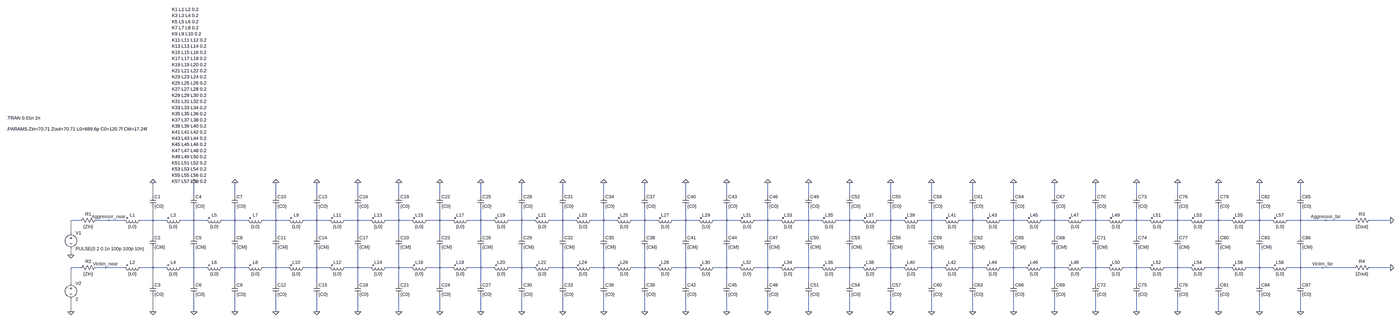
[diagram p0: schematic Exercise 3.asc, whole sheet]
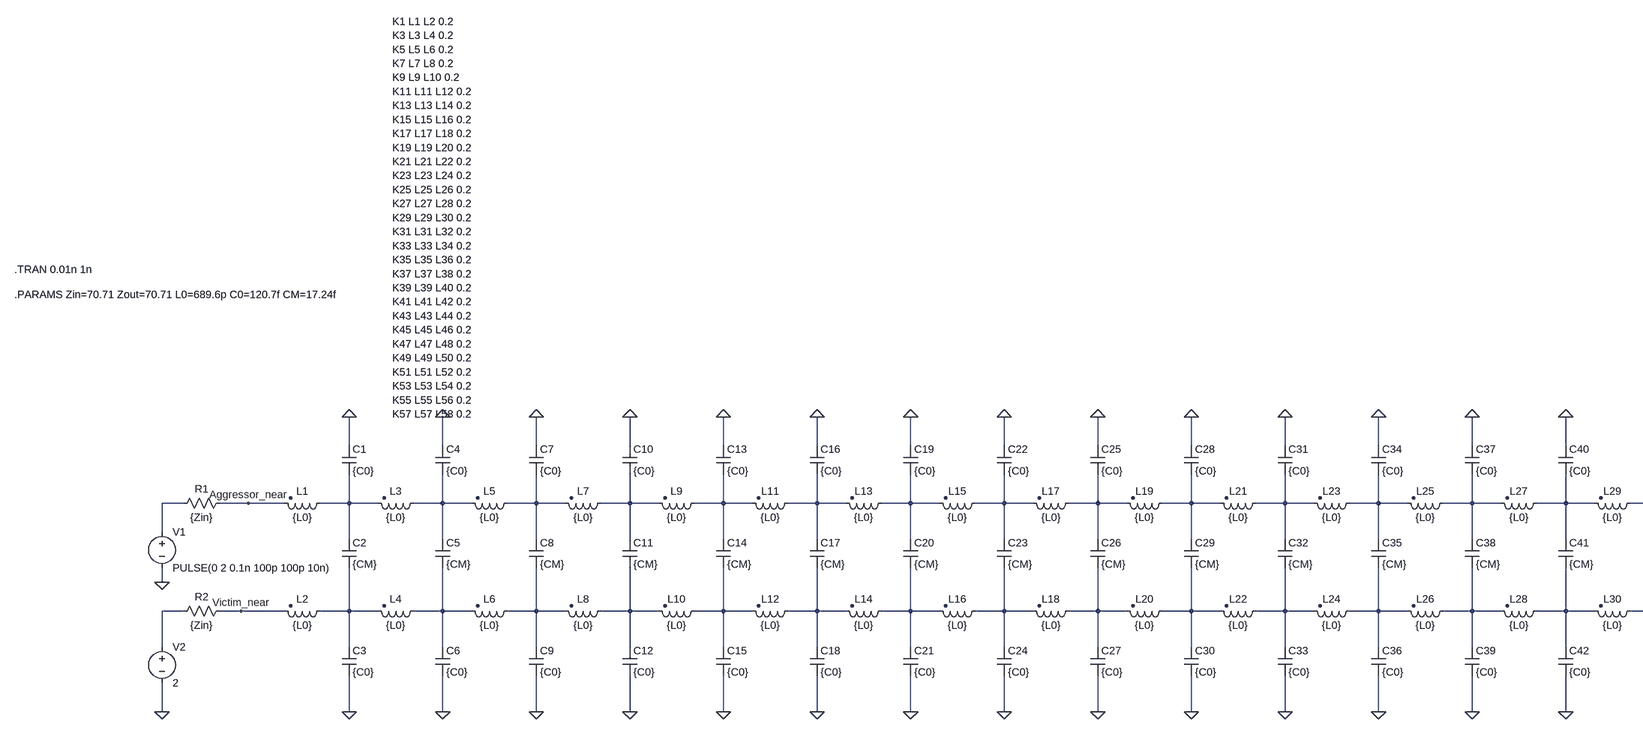
[diagram p1: schematic Exercise 3.asc, part, row 1 of 1, column 1 of 2]
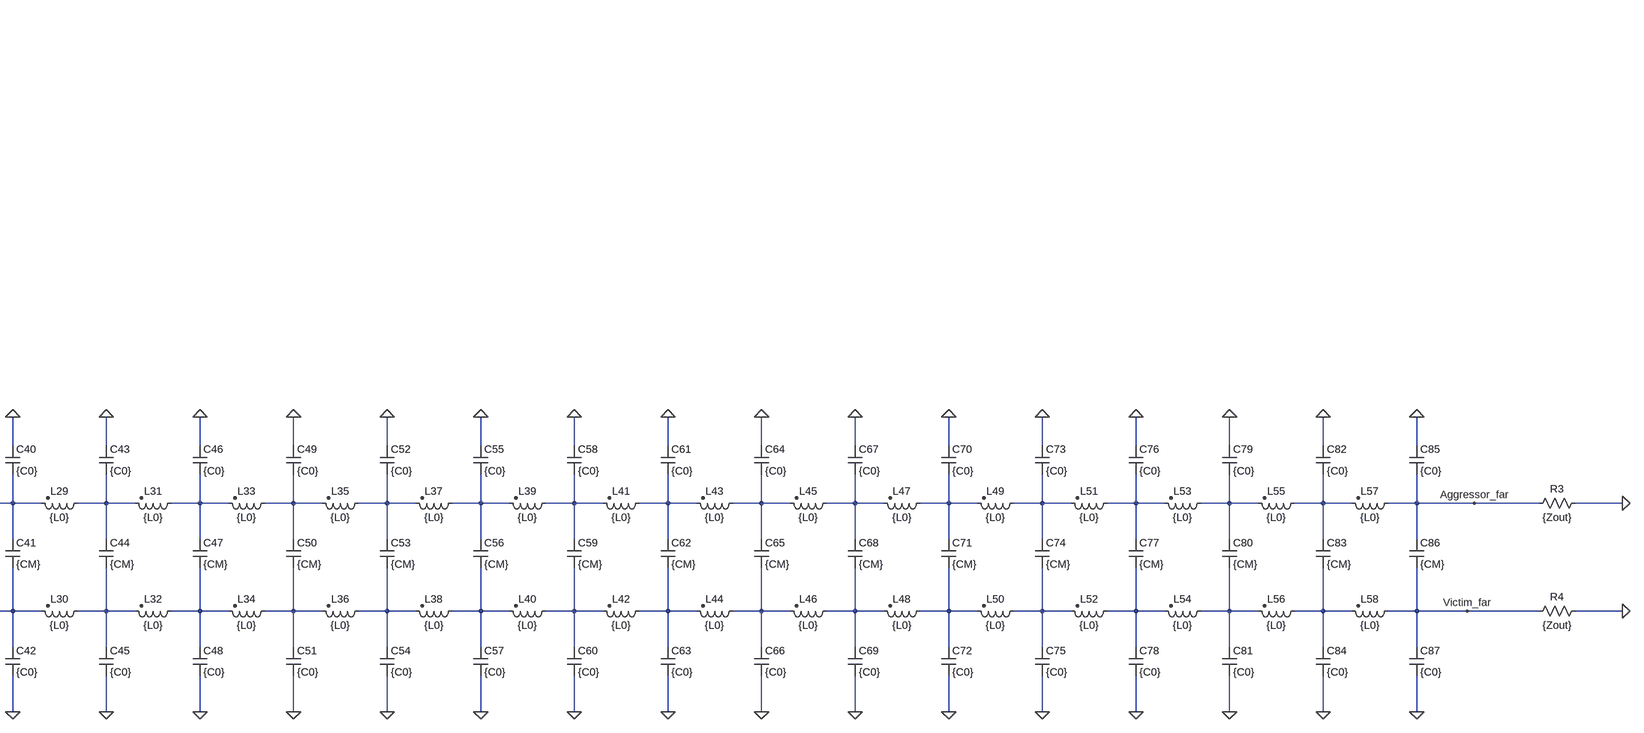
[diagram p2: schematic Exercise 3.asc, part, row 1 of 1, column 2 of 2]
Exercise 3.asc, the LTspice schematic file:
Version 4
SHEET 1 6640 752
WIRE 336 144 336 80
WIRE 544 144 544 80
WIRE 752 144 752 80
WIRE 960 144 960 80
WIRE 1168 144 1168 80
WIRE 1376 144 1376 80
WIRE 1584 144 1584 80
WIRE 1792 144 1792 80
WIRE 2000 144 2000 80
WIRE 2208 144 2208 80
WIRE 2416 144 2416 80
WIRE 2624 144 2624 80
WIRE 2832 144 2832 80
WIRE 3040 144 3040 80
WIRE 3248 144 3248 80
WIRE 3456 144 3456 80
WIRE 3664 144 3664 80
WIRE 3872 144 3872 80
WIRE 4080 144 4080 80
WIRE 4288 144 4288 80
WIRE 4496 144 4496 80
WIRE 4704 144 4704 80
WIRE 4912 144 4912 80
WIRE 5120 144 5120 80
WIRE 5328 144 5328 80
WIRE 5536 144 5536 80
WIRE 5744 144 5744 80
WIRE 5952 144 5952 80
WIRE 6160 144 6160 80
WIRE -32 272 -80 272
WIRE 112 272 48 272
WIRE 192 272 112 272
WIRE 336 272 336 208
WIRE 336 272 272 272
WIRE 400 272 336 272
WIRE 544 272 544 208
WIRE 544 272 480 272
WIRE 608 272 544 272
WIRE 752 272 752 208
WIRE 752 272 688 272
WIRE 816 272 752 272
WIRE 960 272 960 208
WIRE 960 272 896 272
WIRE 1024 272 960 272
WIRE 1168 272 1168 208
WIRE 1168 272 1104 272
WIRE 1232 272 1168 272
WIRE 1376 272 1376 208
WIRE 1376 272 1312 272
WIRE 1440 272 1376 272
WIRE 1584 272 1584 208
WIRE 1584 272 1520 272
WIRE 1648 272 1584 272
WIRE 1792 272 1792 208
WIRE 1792 272 1728 272
WIRE 1856 272 1792 272
WIRE 2000 272 2000 208
WIRE 2000 272 1936 272
WIRE 2064 272 2000 272
WIRE 2208 272 2208 208
WIRE 2208 272 2144 272
WIRE 2272 272 2208 272
WIRE 2416 272 2416 208
WIRE 2416 272 2352 272
WIRE 2480 272 2416 272
WIRE 2624 272 2624 208
WIRE 2624 272 2560 272
WIRE 2688 272 2624 272
WIRE 2832 272 2832 208
WIRE 2832 272 2768 272
WIRE 2896 272 2832 272
WIRE 3040 272 3040 208
WIRE 3040 272 2976 272
WIRE 3104 272 3040 272
WIRE 3248 272 3248 208
WIRE 3248 272 3184 272
WIRE 3312 272 3248 272
WIRE 3456 272 3456 208
WIRE 3456 272 3392 272
WIRE 3520 272 3456 272
WIRE 3664 272 3664 208
WIRE 3664 272 3600 272
WIRE 3728 272 3664 272
WIRE 3872 272 3872 208
WIRE 3872 272 3808 272
WIRE 3936 272 3872 272
WIRE 4080 272 4080 208
WIRE 4080 272 4016 272
WIRE 4144 272 4080 272
WIRE 4288 272 4288 208
WIRE 4288 272 4224 272
WIRE 4352 272 4288 272
WIRE 4496 272 4496 208
WIRE 4496 272 4432 272
WIRE 4560 272 4496 272
WIRE 4704 272 4704 208
WIRE 4704 272 4640 272
WIRE 4768 272 4704 272
WIRE 4912 272 4912 208
WIRE 4912 272 4848 272
WIRE 4976 272 4912 272
WIRE 5120 272 5120 208
WIRE 5120 272 5056 272
WIRE 5184 272 5120 272
WIRE 5328 272 5328 208
WIRE 5328 272 5264 272
WIRE 5392 272 5328 272
WIRE 5536 272 5536 208
WIRE 5536 272 5472 272
WIRE 5600 272 5536 272
WIRE 5744 272 5744 208
WIRE 5744 272 5680 272
WIRE 5808 272 5744 272
WIRE 5952 272 5952 208
WIRE 5952 272 5888 272
WIRE 6016 272 5952 272
WIRE 6160 272 6160 208
WIRE 6160 272 6096 272
WIRE 6288 272 6160 272
WIRE 6432 272 6288 272
WIRE 6624 272 6512 272
WIRE -80 336 -80 272
WIRE 336 352 336 272
WIRE 544 352 544 272
WIRE 752 352 752 272
WIRE 960 352 960 272
WIRE 1168 352 1168 272
WIRE 1376 352 1376 272
WIRE 1584 352 1584 272
WIRE 1792 352 1792 272
WIRE 2000 352 2000 272
WIRE 2208 352 2208 272
WIRE 2416 352 2416 272
WIRE 2624 352 2624 272
WIRE 2832 352 2832 272
WIRE 3040 352 3040 272
WIRE 3248 352 3248 272
WIRE 3456 352 3456 272
WIRE 3664 352 3664 272
WIRE 3872 352 3872 272
WIRE 4080 352 4080 272
WIRE 4288 352 4288 272
WIRE 4496 352 4496 272
WIRE 4704 352 4704 272
WIRE 4912 352 4912 272
WIRE 5120 352 5120 272
WIRE 5328 352 5328 272
WIRE 5536 352 5536 272
WIRE 5744 352 5744 272
WIRE 5952 352 5952 272
WIRE 6160 352 6160 272
WIRE -80 448 -80 416
WIRE -32 512 -80 512
WIRE 96 512 48 512
WIRE 192 512 96 512
WIRE 336 512 336 416
WIRE 336 512 272 512
WIRE 400 512 336 512
WIRE 544 512 544 416
WIRE 544 512 480 512
WIRE 608 512 544 512
WIRE 752 512 752 416
WIRE 752 512 688 512
WIRE 816 512 752 512
WIRE 960 512 960 416
WIRE 960 512 896 512
WIRE 1024 512 960 512
WIRE 1168 512 1168 416
WIRE 1168 512 1104 512
WIRE 1232 512 1168 512
WIRE 1376 512 1376 416
WIRE 1376 512 1312 512
WIRE 1440 512 1376 512
WIRE 1584 512 1584 416
WIRE 1584 512 1520 512
WIRE 1648 512 1584 512
WIRE 1792 512 1792 416
WIRE 1792 512 1728 512
WIRE 1856 512 1792 512
WIRE 2000 512 2000 416
WIRE 2000 512 1936 512
WIRE 2064 512 2000 512
WIRE 2208 512 2208 416
WIRE 2208 512 2144 512
WIRE 2272 512 2208 512
WIRE 2416 512 2416 416
WIRE 2416 512 2352 512
WIRE 2480 512 2416 512
WIRE 2624 512 2624 416
WIRE 2624 512 2560 512
WIRE 2688 512 2624 512
WIRE 2832 512 2832 416
WIRE 2832 512 2768 512
WIRE 2896 512 2832 512
WIRE 3040 512 3040 416
WIRE 3040 512 2976 512
WIRE 3104 512 3040 512
WIRE 3248 512 3248 416
WIRE 3248 512 3184 512
WIRE 3312 512 3248 512
WIRE 3456 512 3456 416
WIRE 3456 512 3392 512
WIRE 3520 512 3456 512
WIRE 3664 512 3664 416
WIRE 3664 512 3600 512
WIRE 3728 512 3664 512
WIRE 3872 512 3872 416
WIRE 3872 512 3808 512
WIRE 3936 512 3872 512
WIRE 4080 512 4080 416
WIRE 4080 512 4016 512
WIRE 4144 512 4080 512
WIRE 4288 512 4288 416
WIRE 4288 512 4224 512
WIRE 4352 512 4288 512
WIRE 4496 512 4496 416
WIRE 4496 512 4432 512
WIRE 4560 512 4496 512
WIRE 4704 512 4704 416
WIRE 4704 512 4640 512
WIRE 4768 512 4704 512
WIRE 4912 512 4912 416
WIRE 4912 512 4848 512
WIRE 4976 512 4912 512
WIRE 5120 512 5120 416
WIRE 5120 512 5056 512
WIRE 5184 512 5120 512
WIRE 5328 512 5328 416
WIRE 5328 512 5264 512
WIRE 5392 512 5328 512
WIRE 5536 512 5536 416
WIRE 5536 512 5472 512
WIRE 5600 512 5536 512
WIRE 5744 512 5744 416
WIRE 5744 512 5680 512
WIRE 5808 512 5744 512
WIRE 5952 512 5952 416
WIRE 5952 512 5888 512
WIRE 6016 512 5952 512
WIRE 6160 512 6160 416
WIRE 6160 512 6096 512
WIRE 6272 512 6160 512
WIRE 6432 512 6272 512
WIRE 6624 512 6512 512
WIRE -80 592 -80 512
WIRE 336 592 336 512
WIRE 544 592 544 512
WIRE 752 592 752 512
WIRE 960 592 960 512
WIRE 1168 592 1168 512
WIRE 1376 592 1376 512
WIRE 1584 592 1584 512
WIRE 1792 592 1792 512
WIRE 2000 592 2000 512
WIRE 2208 592 2208 512
WIRE 2416 592 2416 512
WIRE 2624 592 2624 512
WIRE 2832 592 2832 512
WIRE 3040 592 3040 512
WIRE 3248 592 3248 512
WIRE 3456 592 3456 512
WIRE 3664 592 3664 512
WIRE 3872 592 3872 512
WIRE 4080 592 4080 512
WIRE 4288 592 4288 512
WIRE 4496 592 4496 512
WIRE 4704 592 4704 512
WIRE 4912 592 4912 512
WIRE 5120 592 5120 512
WIRE 5328 592 5328 512
WIRE 5536 592 5536 512
WIRE 5744 592 5744 512
WIRE 5952 592 5952 512
WIRE 6160 592 6160 512
WIRE -80 736 -80 672
WIRE 336 736 336 656
WIRE 544 736 544 656
WIRE 752 736 752 656
WIRE 960 736 960 656
WIRE 1168 736 1168 656
WIRE 1376 736 1376 656
WIRE 1584 736 1584 656
WIRE 1792 736 1792 656
WIRE 2000 736 2000 656
WIRE 2208 736 2208 656
WIRE 2416 736 2416 656
WIRE 2624 736 2624 656
WIRE 2832 736 2832 656
WIRE 3040 736 3040 656
WIRE 3248 736 3248 656
WIRE 3456 736 3456 656
WIRE 3664 736 3664 656
WIRE 3872 736 3872 656
WIRE 4080 736 4080 656
WIRE 4288 736 4288 656
WIRE 4496 736 4496 656
WIRE 4704 736 4704 656
WIRE 4912 736 4912 656
WIRE 5120 736 5120 656
WIRE 5328 736 5328 656
WIRE 5536 736 5536 656
WIRE 5744 736 5744 656
WIRE 5952 736 5952 656
WIRE 6160 736 6160 656
FLAG 336 80 0
FLAG 336 736 0
FLAG -80 448 0
FLAG -80 736 0
FLAG 544 80 0
FLAG 544 736 0
FLAG 752 80 0
FLAG 752 736 0
FLAG 960 80 0
FLAG 960 736 0
FLAG 1168 80 0
FLAG 1168 736 0
FLAG 1376 80 0
FLAG 1376 736 0
FLAG 1584 80 0
FLAG 1584 736 0
FLAG 1792 80 0
FLAG 1792 736 0
FLAG 2000 80 0
FLAG 2000 736 0
FLAG 2208 80 0
FLAG 2208 736 0
FLAG 2416 80 0
FLAG 2416 736 0
FLAG 2624 80 0
FLAG 2624 736 0
FLAG 2832 80 0
FLAG 2832 736 0
FLAG 3040 80 0
FLAG 3040 736 0
FLAG 3248 80 0
FLAG 3248 736 0
FLAG 3456 80 0
FLAG 3456 736 0
FLAG 3664 80 0
FLAG 3664 736 0
FLAG 3872 80 0
FLAG 3872 736 0
FLAG 4080 80 0
FLAG 4080 736 0
FLAG 4288 80 0
FLAG 4288 736 0
FLAG 4496 80 0
FLAG 4496 736 0
FLAG 4704 80 0
FLAG 4704 736 0
FLAG 4912 80 0
FLAG 4912 736 0
FLAG 5120 80 0
FLAG 5120 736 0
FLAG 5328 80 0
FLAG 5328 736 0
FLAG 5536 80 0
FLAG 5536 736 0
FLAG 5744 80 0
FLAG 5744 736 0
FLAG 5952 80 0
FLAG 5952 736 0
FLAG 6160 80 0
FLAG 6160 736 0
FLAG 6288 272 Aggressor_far
FLAG 6272 512 Victim_far
FLAG 6624 512 0
FLAG 6624 272 0
FLAG 112 272 Aggressor_near
FLAG 96 512 Victim_near
SYMBOL Voltage -80 320 R0
SYMATTR InstName V1
SYMATTR Value PULSE(0 2 0.1n 100p 100p 10n)
SYMBOL Res 64 256 R90
WINDOW 0 0 56 VBottom 2
WINDOW 3 32 56 VTop 2
SYMATTR InstName R1
SYMATTR Value {Zin}
SYMBOL ind2 288 256 R90
WINDOW 0 5 56 VBottom 2
WINDOW 3 32 56 VTop 2
SYMATTR InstName L1
SYMATTR Value {L0}
SYMATTR Type ind
SYMBOL Cap 320 144 R0
SYMATTR InstName C1
SYMATTR Value {C0}
SYMBOL Cap 320 352 R0
SYMATTR InstName C2
SYMATTR Value {CM}
SYMBOL ind2 288 496 R90
WINDOW 0 5 56 VBottom 2
WINDOW 3 32 56 VTop 2
SYMATTR InstName L2
SYMATTR Value {L0}
SYMATTR Type ind
SYMBOL Res 64 496 R90
WINDOW 0 0 56 VBottom 2
WINDOW 3 32 56 VTop 2
SYMATTR InstName R2
SYMATTR Value {Zin}
SYMBOL Cap 320 592 R0
SYMATTR InstName C3
SYMATTR Value {C0}
SYMBOL Voltage -80 576 R0
SYMATTR InstName V2
SYMATTR Value 2
SYMBOL ind2 496 256 R90
WINDOW 0 5 56 VBottom 2
WINDOW 3 32 56 VTop 2
SYMATTR InstName L3
SYMATTR Value {L0}
SYMATTR Type ind
SYMBOL Cap 528 144 R0
SYMATTR InstName C4
SYMATTR Value {C0}
SYMBOL Cap 528 352 R0
SYMATTR InstName C5
SYMATTR Value {CM}
SYMBOL ind2 496 496 R90
WINDOW 0 5 56 VBottom 2
WINDOW 3 32 56 VTop 2
SYMATTR InstName L4
SYMATTR Value {L0}
SYMATTR Type ind
SYMBOL Cap 528 592 R0
SYMATTR InstName C6
SYMATTR Value {C0}
SYMBOL ind2 704 256 R90
WINDOW 0 5 56 VBottom 2
WINDOW 3 32 56 VTop 2
SYMATTR InstName L5
SYMATTR Value {L0}
SYMATTR Type ind
SYMBOL Cap 736 144 R0
SYMATTR InstName C7
SYMATTR Value {C0}
SYMBOL Cap 736 352 R0
SYMATTR InstName C8
SYMATTR Value {CM}
SYMBOL ind2 704 496 R90
WINDOW 0 5 56 VBottom 2
WINDOW 3 32 56 VTop 2
SYMATTR InstName L6
SYMATTR Value {L0}
SYMATTR Type ind
SYMBOL Cap 736 592 R0
SYMATTR InstName C9
SYMATTR Value {C0}
SYMBOL ind2 912 256 R90
WINDOW 0 5 56 VBottom 2
WINDOW 3 32 56 VTop 2
SYMATTR InstName L7
SYMATTR Value {L0}
SYMATTR Type ind
SYMBOL Cap 944 144 R0
SYMATTR InstName C10
SYMATTR Value {C0}
SYMBOL Cap 944 352 R0
SYMATTR InstName C11
SYMATTR Value {CM}
SYMBOL ind2 912 496 R90
WINDOW 0 5 56 VBottom 2
WINDOW 3 32 56 VTop 2
SYMATTR InstName L8
SYMATTR Value {L0}
SYMATTR Type ind
SYMBOL Cap 944 592 R0
SYMATTR InstName C12
SYMATTR Value {C0}
SYMBOL ind2 1120 256 R90
WINDOW 0 5 56 VBottom 2
WINDOW 3 32 56 VTop 2
SYMATTR InstName L9
SYMATTR Value {L0}
SYMATTR Type ind
SYMBOL Cap 1152 144 R0
SYMATTR InstName C13
SYMATTR Value {C0}
SYMBOL Cap 1152 352 R0
SYMATTR InstName C14
SYMATTR Value {CM}
SYMBOL ind2 1120 496 R90
WINDOW 0 5 56 VBottom 2
WINDOW 3 32 56 VTop 2
SYMATTR InstName L10
SYMATTR Value {L0}
SYMATTR Type ind
SYMBOL Cap 1152 592 R0
SYMATTR InstName C15
SYMATTR Value {C0}
SYMBOL ind2 1328 256 R90
WINDOW 0 5 56 VBottom 2
WINDOW 3 32 56 VTop 2
SYMATTR InstName L11
SYMATTR Value {L0}
SYMATTR Type ind
SYMBOL Cap 1360 144 R0
SYMATTR InstName C16
SYMATTR Value {C0}
SYMBOL Cap 1360 352 R0
SYMATTR InstName C17
SYMATTR Value {CM}
SYMBOL ind2 1328 496 R90
WINDOW 0 5 56 VBottom 2
WINDOW 3 32 56 VTop 2
SYMATTR InstName L12
SYMATTR Value {L0}
SYMATTR Type ind
SYMBOL Cap 1360 592 R0
SYMATTR InstName C18
SYMATTR Value {C0}
SYMBOL ind2 1536 256 R90
WINDOW 0 5 56 VBottom 2
WINDOW 3 32 56 VTop 2
SYMATTR InstName L13
SYMATTR Value {L0}
SYMATTR Type ind
SYMBOL Cap 1568 144 R0
SYMATTR InstName C19
SYMATTR Value {C0}
SYMBOL Cap 1568 352 R0
SYMATTR InstName C20
SYMATTR Value {CM}
SYMBOL ind2 1536 496 R90
WINDOW 0 5 56 VBottom 2
WINDOW 3 32 56 VTop 2
SYMATTR InstName L14
SYMATTR Value {L0}
SYMATTR Type ind
SYMBOL Cap 1568 592 R0
SYMATTR InstName C21
SYMATTR Value {C0}
SYMBOL ind2 1744 256 R90
WINDOW 0 5 56 VBottom 2
WINDOW 3 32 56 VTop 2
SYMATTR InstName L15
SYMATTR Value {L0}
SYMATTR Type ind
SYMBOL Cap 1776 144 R0
SYMATTR InstName C22
SYMATTR Value {C0}
SYMBOL Cap 1776 352 R0
SYMATTR InstName C23
SYMATTR Value {CM}
SYMBOL ind2 1744 496 R90
WINDOW 0 5 56 VBottom 2
WINDOW 3 32 56 VTop 2
SYMATTR InstName L16
SYMATTR Value {L0}
SYMATTR Type ind
SYMBOL Cap 1776 592 R0
SYMATTR InstName C24
SYMATTR Value {C0}
SYMBOL ind2 1952 256 R90
WINDOW 0 5 56 VBottom 2
WINDOW 3 32 56 VTop 2
SYMATTR InstName L17
SYMATTR Value {L0}
SYMATTR Type ind
SYMBOL Cap 1984 144 R0
SYMATTR InstName C25
SYMATTR Value {C0}
SYMBOL Cap 1984 352 R0
SYMATTR InstName C26
SYMATTR Value {CM}
SYMBOL ind2 1952 496 R90
WINDOW 0 5 56 VBottom 2
WINDOW 3 32 56 VTop 2
SYMATTR InstName L18
SYMATTR Value {L0}
SYMATTR Type ind
SYMBOL Cap 1984 592 R0
SYMATTR InstName C27
SYMATTR Value {C0}
SYMBOL ind2 2160 256 R90
WINDOW 0 5 56 VBottom 2
WINDOW 3 32 56 VTop 2
SYMATTR InstName L19
SYMATTR Value {L0}
SYMATTR Type ind
SYMBOL Cap 2192 144 R0
SYMATTR InstName C28
SYMATTR Value {C0}
SYMBOL Cap 2192 352 R0
SYMATTR InstName C29
SYMATTR Value {CM}
SYMBOL ind2 2160 496 R90
WINDOW 0 5 56 VBottom 2
WINDOW 3 32 56 VTop 2
SYMATTR InstName L20
SYMATTR Value {L0}
SYMATTR Type ind
SYMBOL Cap 2192 592 R0
SYMATTR InstName C30
SYMATTR Value {C0}
SYMBOL ind2 2368 256 R90
WINDOW 0 5 56 VBottom 2
WINDOW 3 32 56 VTop 2
SYMATTR InstName L21
SYMATTR Value {L0}
SYMATTR Type ind
SYMBOL Cap 2400 144 R0
SYMATTR InstName C31
SYMATTR Value {C0}
SYMBOL Cap 2400 352 R0
SYMATTR InstName C32
SYMATTR Value {CM}
SYMBOL ind2 2368 496 R90
WINDOW 0 5 56 VBottom 2
WINDOW 3 32 56 VTop 2
SYMATTR InstName L22
SYMATTR Value {L0}
SYMATTR Type ind
SYMBOL Cap 2400 592 R0
SYMATTR InstName C33
SYMATTR Value {C0}
SYMBOL ind2 2576 256 R90
WINDOW 0 5 56 VBottom 2
WINDOW 3 32 56 VTop 2
SYMATTR InstName L23
SYMATTR Value {L0}
SYMATTR Type ind
SYMBOL Cap 2608 144 R0
SYMATTR InstName C34
SYMATTR Value {C0}
SYMBOL Cap 2608 352 R0
SYMATTR InstName C35
SYMATTR Value {CM}
SYMBOL ind2 2576 496 R90
WINDOW 0 5 56 VBottom 2
WINDOW 3 32 56 VTop 2
SYMATTR InstName L24
SYMATTR Value {L0}
SYMATTR Type ind
SYMBOL Cap 2608 592 R0
SYMATTR InstName C36
SYMATTR Value {C0}
SYMBOL ind2 2784 256 R90
WINDOW 0 5 56 VBottom 2
WINDOW 3 32 56 VTop 2
SYMATTR InstName L25
SYMATTR Value {L0}
SYMATTR Type ind
SYMBOL Cap 2816 144 R0
SYMATTR InstName C37
SYMATTR Value {C0}
SYMBOL Cap 2816 352 R0
SYMATTR InstName C38
SYMATTR Value {CM}
SYMBOL ind2 2784 496 R90
WINDOW 0 5 56 VBottom 2
WINDOW 3 32 56 VTop 2
SYMATTR InstName L26
SYMATTR Value {L0}
SYMATTR Type ind
SYMBOL Cap 2816 592 R0
SYMATTR InstName C39
SYMATTR Value {C0}
SYMBOL ind2 2992 256 R90
WINDOW 0 5 56 VBottom 2
WINDOW 3 32 56 VTop 2
SYMATTR InstName L27
SYMATTR Value {L0}
SYMATTR Type ind
SYMBOL Cap 3024 144 R0
SYMATTR InstName C40
SYMATTR Value {C0}
SYMBOL Cap 3024 352 R0
SYMATTR InstName C41
SYMATTR Value {CM}
SYMBOL ind2 2992 496 R90
WINDOW 0 5 56 VBottom 2
WINDOW 3 32 56 VTop 2
SYMATTR InstName L28
SYMATTR Value {L0}
SYMATTR Type ind
SYMBOL Cap 3024 592 R0
SYMATTR InstName C42
SYMATTR Value {C0}
SYMBOL ind2 3200 256 R90
WINDOW 0 5 56 VBottom 2
WINDOW 3 32 56 VTop 2
SYMATTR InstName L29
SYMATTR Value {L0}
SYMATTR Type ind
SYMBOL Cap 3232 144 R0
SYMATTR InstName C43
SYMATTR Value {C0}
SYMBOL Cap 3232 352 R0
SYMATTR InstName C44
SYMATTR Value {CM}
SYMBOL ind2 3200 496 R90
WINDOW 0 5 56 VBottom 2
WINDOW 3 32 56 VTop 2
SYMATTR InstName L30
SYMATTR Value {L0}
SYMATTR Type ind
SYMBOL Cap 3232 592 R0
SYMATTR InstName C45
SYMATTR Value {C0}
SYMBOL ind2 3408 256 R90
WINDOW 0 5 56 VBottom 2
WINDOW 3 32 56 VTop 2
SYMATTR InstName L31
SYMATTR Value {L0}
SYMATTR Type ind
SYMBOL Cap 3440 144 R0
SYMATTR InstName C46
SYMATTR Value {C0}
SYMBOL Cap 3440 352 R0
SYMATTR InstName C47
SYMATTR Value {CM}
SYMBOL ind2 3408 496 R90
WINDOW 0 5 56 VBottom 2
WINDOW 3 32 56 VTop 2
SYMATTR InstName L32
SYMATTR Value {L0}
SYMATTR Type ind
SYMBOL Cap 3440 592 R0
SYMATTR InstName C48
SYMATTR Value {C0}
SYMBOL ind2 3616 256 R90
WINDOW 0 5 56 VBottom 2
WINDOW 3 32 56 VTop 2
SYMATTR InstName L33
SYMATTR Value {L0}
SYMATTR Type ind
SYMBOL Cap 3648 144 R0
SYMATTR InstName C49
SYMATTR Value {C0}
SYMBOL Cap 3648 352 R0
SYMATTR InstName C50
SYMATTR Value {CM}
SYMBOL ind2 3616 496 R90
WINDOW 0 5 56 VBottom 2
WINDOW 3 32 56 VTop 2
SYMATTR InstName L34
SYMATTR Value {L0}
SYMATTR Type ind
SYMBOL Cap 3648 592 R0
SYMATTR InstName C51
SYMATTR Value {C0}
SYMBOL ind2 3824 256 R90
WINDOW 0 5 56 VBottom 2
WINDOW 3 32 56 VTop 2
SYMATTR InstName L35
SYMATTR Value {L0}
SYMATTR Type ind
SYMBOL Cap 3856 144 R0
SYMATTR InstName C52
SYMATTR Value {C0}
SYMBOL Cap 3856 352 R0
SYMATTR InstName C53
SYMATTR Value {CM}
SYMBOL ind2 3824 496 R90
WINDOW 0 5 56 VBottom 2
WINDOW 3 32 56 VTop 2
SYMATTR InstName L36
SYMATTR Value {L0}
SYMATTR Type ind
SYMBOL Cap 3856 592 R0
SYMATTR InstName C54
SYMATTR Value {C0}
SYMBOL ind2 4032 256 R90
WINDOW 0 5 56 VBottom 2
WINDOW 3 32 56 VTop 2
SYMATTR InstName L37
SYMATTR Value {L0}
SYMATTR Type ind
SYMBOL Cap 4064 144 R0
SYMATTR InstName C55
SYMATTR Value {C0}
SYMBOL Cap 4064 352 R0
SYMATTR InstName C56
SYMATTR Value {CM}
SYMBOL ind2 4032 496 R90
WINDOW 0 5 56 VBottom 2
WINDOW 3 32 56 VTop 2
SYMATTR InstName L38
SYMATTR Value {L0}
SYMATTR Type ind
SYMBOL Cap 4064 592 R0
SYMATTR InstName C57
SYMATTR Value {C0}
SYMBOL ind2 4240 256 R90
WINDOW 0 5 56 VBottom 2
WINDOW 3 32 56 VTop 2
SYMATTR InstName L39
SYMATTR Value {L0}
SYMATTR Type ind
SYMBOL Cap 4272 144 R0
SYMATTR InstName C58
SYMATTR Value {C0}
SYMBOL Cap 4272 352 R0
SYMATTR InstName C59
SYMATTR Value {CM}
SYMBOL ind2 4240 496 R90
WINDOW 0 5 56 VBottom 2
WINDOW 3 32 56 VTop 2
SYMATTR InstName L40
SYMATTR Value {L0}
SYMATTR Type ind
SYMBOL Cap 4272 592 R0
SYMATTR InstName C60
SYMATTR Value {C0}
SYMBOL ind2 4448 256 R90
WINDOW 0 5 56 VBottom 2
WINDOW 3 32 56 VTop 2
SYMATTR InstName L41
SYMATTR Value {L0}
SYMATTR Type ind
SYMBOL Cap 4480 144 R0
SYMATTR InstName C61
SYMATTR Value {C0}
SYMBOL Cap 4480 352 R0
SYMATTR InstName C62
SYMATTR Value {CM}
SYMBOL ind2 4448 496 R90
WINDOW 0 5 56 VBottom 2
WINDOW 3 32 56 VTop 2
SYMATTR InstName L42
SYMATTR Value {L0}
SYMATTR Type ind
SYMBOL Cap 4480 592 R0
SYMATTR InstName C63
SYMATTR Value {C0}
SYMBOL ind2 4656 256 R90
WINDOW 0 5 56 VBottom 2
WINDOW 3 32 56 VTop 2
SYMATTR InstName L43
SYMATTR Value {L0}
SYMATTR Type ind
SYMBOL Cap 4688 144 R0
SYMATTR InstName C64
SYMATTR Value {C0}
SYMBOL Cap 4688 352 R0
SYMATTR InstName C65
SYMATTR Value {CM}
SYMBOL ind2 4656 496 R90
WINDOW 0 5 56 VBottom 2
WINDOW 3 32 56 VTop 2
SYMATTR InstName L44
SYMATTR Value {L0}
SYMATTR Type ind
SYMBOL Cap 4688 592 R0
SYMATTR InstName C66
SYMATTR Value {C0}
SYMBOL ind2 4864 256 R90
WINDOW 0 5 56 VBottom 2
WINDOW 3 32 56 VTop 2
SYMATTR InstName L45
SYMATTR Value {L0}
SYMATTR Type ind
SYMBOL Cap 4896 144 R0
SYMATTR InstName C67
SYMATTR Value {C0}
SYMBOL Cap 4896 352 R0
SYMATTR InstName C68
SYMATTR Value {CM}
SYMBOL ind2 4864 496 R90
WINDOW 0 5 56 VBottom 2
WINDOW 3 32 56 VTop 2
SYMATTR InstName L46
SYMATTR Value {L0}
SYMATTR Type ind
SYMBOL Cap 4896 592 R0
SYMATTR InstName C69
SYMATTR Value {C0}
SYMBOL ind2 5072 256 R90
WINDOW 0 5 56 VBottom 2
WINDOW 3 32 56 VTop 2
SYMATTR InstName L47
SYMATTR Value {L0}
SYMATTR Type ind
SYMBOL Cap 5104 144 R0
SYMATTR InstName C70
SYMATTR Value {C0}
SYMBOL Cap 5104 352 R0
SYMATTR InstName C71
SYMATTR Value {CM}
SYMBOL ind2 5072 496 R90
WINDOW 0 5 56 VBottom 2
WINDOW 3 32 56 VTop 2
SYMATTR InstName L48
SYMATTR Value {L0}
SYMATTR Type ind
SYMBOL Cap 5104 592 R0
SYMATTR InstName C72
SYMATTR Value {C0}
SYMBOL ind2 5280 256 R90
WINDOW 0 5 56 VBottom 2
WINDOW 3 32 56 VTop 2
SYMATTR InstName L49
SYMATTR Value {L0}
SYMATTR Type ind
SYMBOL Cap 5312 144 R0
SYMATTR InstName C73
SYMATTR Value {C0}
SYMBOL Cap 5312 352 R0
SYMATTR InstName C74
SYMATTR Value {CM}
SYMBOL ind2 5280 496 R90
WINDOW 0 5 56 VBottom 2
WINDOW 3 32 56 VTop 2
SYMATTR InstName L50
SYMATTR Value {L0}
SYMATTR Type ind
SYMBOL Cap 5312 592 R0
SYMATTR InstName C75
SYMATTR Value {C0}
SYMBOL ind2 5488 256 R90
WINDOW 0 5 56 VBottom 2
WINDOW 3 32 56 VTop 2
SYMATTR InstName L51
SYMATTR Value {L0}
SYMATTR Type ind
SYMBOL Cap 5520 144 R0
SYMATTR InstName C76
SYMATTR Value {C0}
SYMBOL Cap 5520 352 R0
SYMATTR InstName C77
SYMATTR Value {CM}
SYMBOL ind2 5488 496 R90
WINDOW 0 5 56 VBottom 2
WINDOW 3 32 56 VTop 2
SYMATTR InstName L52
SYMATTR Value {L0}
SYMATTR Type ind
SYMBOL Cap 5520 592 R0
SYMATTR InstName C78
SYMATTR Value {C0}
SYMBOL ind2 5696 256 R90
WINDOW 0 5 56 VBottom 2
WINDOW 3 32 56 VTop 2
SYMATTR InstName L53
SYMATTR Value {L0}
SYMATTR Type ind
SYMBOL Cap 5728 144 R0
SYMATTR InstName C79
SYMATTR Value {C0}
SYMBOL Cap 5728 352 R0
SYMATTR InstName C80
SYMATTR Value {CM}
SYMBOL ind2 5696 496 R90
WINDOW 0 5 56 VBottom 2
WINDOW 3 32 56 VTop 2
SYMATTR InstName L54
SYMATTR Value {L0}
SYMATTR Type ind
SYMBOL Cap 5728 592 R0
SYMATTR InstName C81
SYMATTR Value {C0}
SYMBOL ind2 5904 256 R90
WINDOW 0 5 56 VBottom 2
WINDOW 3 32 56 VTop 2
SYMATTR InstName L55
SYMATTR Value {L0}
SYMATTR Type ind
SYMBOL Cap 5936 144 R0
SYMATTR InstName C82
SYMATTR Value {C0}
SYMBOL Cap 5936 352 R0
SYMATTR InstName C83
SYMATTR Value {CM}
SYMBOL ind2 5904 496 R90
WINDOW 0 5 56 VBottom 2
WINDOW 3 32 56 VTop 2
SYMATTR InstName L56
SYMATTR Value {L0}
SYMATTR Type ind
SYMBOL Cap 5936 592 R0
SYMATTR InstName C84
SYMATTR Value {C0}
SYMBOL ind2 6112 256 R90
WINDOW 0 5 56 VBottom 2
WINDOW 3 32 56 VTop 2
SYMATTR InstName L57
SYMATTR Value {L0}
SYMATTR Type ind
SYMBOL Cap 6144 144 R0
SYMATTR InstName C85
SYMATTR Value {C0}
SYMBOL Cap 6144 352 R0
SYMATTR InstName C86
SYMATTR Value {CM}
SYMBOL ind2 6112 496 R90
WINDOW 0 5 56 VBottom 2
WINDOW 3 32 56 VTop 2
SYMATTR InstName L58
SYMATTR Value {L0}
SYMATTR Type ind
SYMBOL Cap 6144 592 R0
SYMATTR InstName C87
SYMATTR Value {C0}
SYMBOL Res 6528 256 R90
WINDOW 0 0 56 VBottom 2
WINDOW 3 32 56 VTop 2
SYMATTR InstName R3
SYMATTR Value {Zout}
SYMBOL Res 6528 496 R90
WINDOW 0 0 56 VBottom 2
WINDOW 3 32 56 VTop 2
SYMATTR InstName R4
SYMATTR Value {Zout}
TEXT -408 -248 Left 2 !.TRAN 0.01n 1n
TEXT -408 -192 Left 2 !.PARAMS Zin=70.71 Zout=70.71 L0=689.6p C0=120.7f CM=17.24f
TEXT 432 -800 Left 2 !K1 L1 L2 0.2\nK3 L3 L4 0.2\nK5 L5 L6 0.2\nK7 L7 L8 0.2\nK9 L9 L10 0.2\nK11 L11 L12 0.2\nK13 L13 L14 0.2\nK15 L15 L16 0.2\nK17 L17 L18 0.2\nK19 L19 L20 0.2\nK21 L21 L22 0.2\nK23 L23 L24 0.2\nK25 L25 L26 0.2\nK27 L27 L28 0.2\nK29 L29 L30 0.2\nK31 L31 L32 0.2\nK33 L33 L34 0.2\nK35 L35 L36 0.2\nK37 L37 L38 0.2\nK39 L39 L40 0.2\nK41 L41 L42 0.2\nK43 L43 L44 0.2\nK45 L45 L46 0.2\nK47 L47 L48 0.2\nK49 L49 L50 0.2\nK51 L51 L52 0.2\nK53 L53 L54 0.2\nK55 L55 L56 0.2\nK57 L57 L58 0.2

The netlist it stands for:
* Exercise 3.asc
V1 N001 0 PULSE(0 2 0.1n 100p 100p 10n)
R1 Aggressor_near N001 {Zin}
L1 N002 Aggressor_near {L0}
C1 0 N002 {C0}
C2 N002 N031 {CM}
L2 N031 Victim_near {L0}
R2 Victim_near N030 {Zin}
C3 N031 0 {C0}
V2 N030 0 2
L3 N003 N002 {L0}
C4 0 N003 {C0}
C5 N003 N032 {CM}
L4 N032 N031 {L0}
C6 N032 0 {C0}
L5 N004 N003 {L0}
C7 0 N004 {C0}
C8 N004 N033 {CM}
L6 N033 N032 {L0}
C9 N033 0 {C0}
L7 N005 N004 {L0}
C10 0 N005 {C0}
C11 N005 N034 {CM}
L8 N034 N033 {L0}
C12 N034 0 {C0}
L9 N006 N005 {L0}
C13 0 N006 {C0}
C14 N006 N035 {CM}
L10 N035 N034 {L0}
C15 N035 0 {C0}
L11 N007 N006 {L0}
C16 0 N007 {C0}
C17 N007 N036 {CM}
L12 N036 N035 {L0}
C18 N036 0 {C0}
L13 N008 N007 {L0}
C19 0 N008 {C0}
C20 N008 N037 {CM}
L14 N037 N036 {L0}
C21 N037 0 {C0}
L15 N009 N008 {L0}
C22 0 N009 {C0}
C23 N009 N038 {CM}
L16 N038 N037 {L0}
C24 N038 0 {C0}
L17 N010 N009 {L0}
C25 0 N010 {C0}
C26 N010 N039 {CM}
L18 N039 N038 {L0}
C27 N039 0 {C0}
L19 N011 N010 {L0}
C28 0 N011 {C0}
C29 N011 N040 {CM}
L20 N040 N039 {L0}
C30 N040 0 {C0}
L21 N012 N011 {L0}
C31 0 N012 {C0}
C32 N012 N041 {CM}
L22 N041 N040 {L0}
C33 N041 0 {C0}
L23 N013 N012 {L0}
C34 0 N013 {C0}
C35 N013 N042 {CM}
L24 N042 N041 {L0}
C36 N042 0 {C0}
L25 N014 N013 {L0}
C37 0 N014 {C0}
C38 N014 N043 {CM}
L26 N043 N042 {L0}
C39 N043 0 {C0}
L27 N015 N014 {L0}
C40 0 N015 {C0}
C41 N015 N044 {CM}
L28 N044 N043 {L0}
C42 N044 0 {C0}
L29 N016 N015 {L0}
C43 0 N016 {C0}
C44 N016 N045 {CM}
L30 N045 N044 {L0}
C45 N045 0 {C0}
L31 N017 N016 {L0}
C46 0 N017 {C0}
C47 N017 N046 {CM}
L32 N046 N045 {L0}
C48 N046 0 {C0}
L33 N018 N017 {L0}
C49 0 N018 {C0}
C50 N018 N047 {CM}
L34 N047 N046 {L0}
C51 N047 0 {C0}
L35 N019 N018 {L0}
C52 0 N019 {C0}
C53 N019 N048 {CM}
L36 N048 N047 {L0}
C54 N048 0 {C0}
L37 N020 N019 {L0}
C55 0 N020 {C0}
C56 N020 N049 {CM}
L38 N049 N048 {L0}
C57 N049 0 {C0}
L39 N021 N020 {L0}
C58 0 N021 {C0}
C59 N021 N050 {CM}
L40 N050 N049 {L0}
C60 N050 0 {C0}
L41 N022 N021 {L0}
C61 0 N022 {C0}
C62 N022 N051 {CM}
L42 N051 N050 {L0}
C63 N051 0 {C0}
L43 N023 N022 {L0}
C64 0 N023 {C0}
C65 N023 N052 {CM}
L44 N052 N051 {L0}
C66 N052 0 {C0}
L45 N024 N023 {L0}
C67 0 N024 {C0}
C68 N024 N053 {CM}
L46 N053 N052 {L0}
C69 N053 0 {C0}
L47 N025 N024 {L0}
C70 0 N025 {C0}
C71 N025 N054 {CM}
L48 N054 N053 {L0}
C72 N054 0 {C0}
L49 N026 N025 {L0}
C73 0 N026 {C0}
C74 N026 N055 {CM}
L50 N055 N054 {L0}
C75 N055 0 {C0}
L51 N027 N026 {L0}
C76 0 N027 {C0}
C77 N027 N056 {CM}
L52 N056 N055 {L0}
C78 N056 0 {C0}
L53 N028 N027 {L0}
C79 0 N028 {C0}
C80 N028 N057 {CM}
L54 N057 N056 {L0}
C81 N057 0 {C0}
L55 N029 N028 {L0}
C82 0 N029 {C0}
C83 N029 N058 {CM}
L56 N058 N057 {L0}
C84 N058 0 {C0}
L57 Aggressor_far N029 {L0}
C85 0 Aggressor_far {C0}
C86 Aggressor_far Victim_far {CM}
L58 Victim_far N058 {L0}
C87 Victim_far 0 {C0}
R3 0 Aggressor_far {Zout}
R4 0 Victim_far {Zout}
.TRAN 0.01n 1n
.PARAMS Zin=70.71 Zout=70.71 L0=689.6p C0=120.7f CM=17.24f
K1 L1 L2 0.2
K3 L3 L4 0.2
K5 L5 L6 0.2
K7 L7 L8 0.2
K9 L9 L10 0.2
K11 L11 L12 0.2
K13 L13 L14 0.2
K15 L15 L16 0.2
K17 L17 L18 0.2
K19 L19 L20 0.2
K21 L21 L22 0.2
K23 L23 L24 0.2
K25 L25 L26 0.2
K27 L27 L28 0.2
K29 L29 L30 0.2
K31 L31 L32 0.2
K33 L33 L34 0.2
K35 L35 L36 0.2
K37 L37 L38 0.2
K39 L39 L40 0.2
K41 L41 L42 0.2
K43 L43 L44 0.2
K45 L45 L46 0.2
K47 L47 L48 0.2
K49 L49 L50 0.2
K51 L51 L52 0.2
K53 L53 L54 0.2
K55 L55 L56 0.2
K57 L57 L58 0.2
.backanno
.end